# Altium schematic sheet FE.SchDoc
size 297 x 209 mm
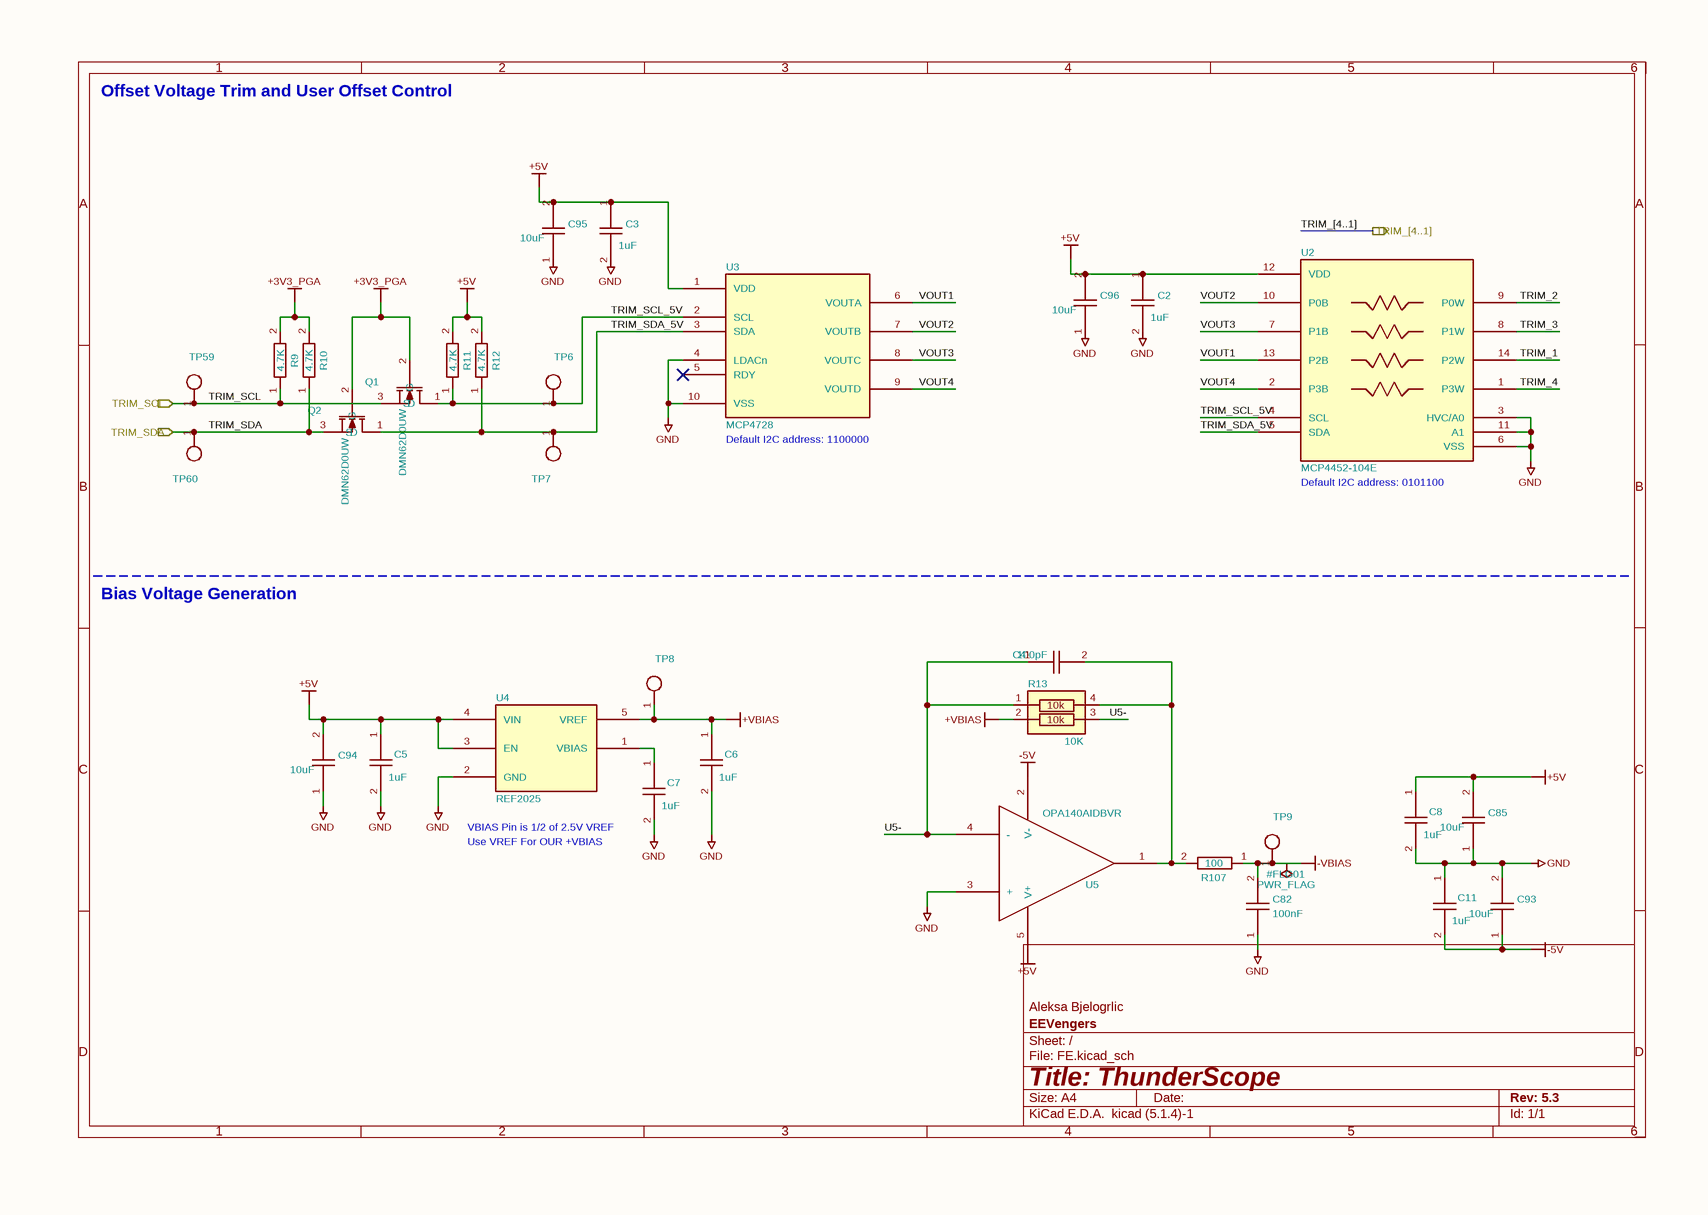
[diagram p0: FE.SchDoc]

## Parts
#FLG01  PWR_FLAG  (graphical)
C2  1uF  [GEN_C_0402]
C3  1uF  [GEN_C_0402]
C4  100pF  [GEN_C_0402]
C5  1uF  [GEN_C_0402]
C6  1uF  [GEN_C_0402]
C7  1uF  [GEN_C_0402]
C8  1uF  [GEN_C_0402]
C11  1uF  [GEN_C_0402]
C82  100nF  [GEN_C_0402]
C85  10uF  [GEN_C_0603]
C93  10uF  [GEN_C_0603]
C94  10uF  [GEN_C_0603]
C95  10uF  [GEN_C_0603]
C96  10uF  [GEN_C_0603]
Q1  DMN62D0UW  [GEN_SOT_323]
Q2  DMN62D0UW  [GEN_SOT_323]
R9  4.7K  [GEN_R_0402]
R10  4.7K  [GEN_R_0402]
R11  4.7K  [GEN_R_0402]
R12  4.7K  [GEN_R_0402]
R13  10K  [GEN_R_2ARRAY_0606]
R107  100  [GEN_R_0402]
TP6  PCB  [GEN_TP_PCB]  (value not drawn)
TP7  PCB  [GEN_TP_PCB]  (value not drawn)
TP8  PCB  [GEN_TP_PCB]  (value not drawn)
TP9  PCB  [GEN_TP_PCB]  (value not drawn)
TP59  PCB  [GEN_TP_PCB]  (value not drawn)
TP60  PCB  [GEN_TP_PCB]  (value not drawn)
U2  MCP4452-104E  [MC_TSSOP14]
U3  MCP4728  [MC_MSOP10_UN]
U4  REF2025  [GEN_SOT23_5_950_2900X1600X1450]
U5  OPA140AIDBVR  [GEN_SOT23_5_950_2900X1600X1450]

## Ports
TRIM_[4..1] (out), TRIM_SCL (in), TRIM_SDA (in)

## Nets
+3V3_PGA: Q1.2(G) Q2.2(G) R9.2 R10.2
+5V: C2.1 C3.1 C5.1 C8.1 C85.2 C94.2 C95.2 C96.2 R11.2 R12.2 U2.12(VDD) U3.1(VDD) U4.3(EN) U4.4(VIN) U5.5(V+)
+VBIAS: C6.1 R13.2 TP8.1 U4.5(VREF)
-5V: C11.2 C93.1 U5.2(V-)
-VBIAS: #FLG01.1 C82.2 R107.1 TP9.1
GND: C2.2 C3.2 C5.2 C6.2 C7.2 C8.2 C11.1 C82.1 C85.1 C93.2 C94.1 C95.1 C96.1 U2.3(HVC/A0) U2.6(VSS) U2.11(A1) U3.4(LDACn) U3.10(VSS) U4.2(GND) U5.3(+)
TRIM_1: U2.14(P2W)
TRIM_2: U2.9(P0W)
TRIM_3: U2.8(P1W)
TRIM_4: U2.1(P3W)
TRIM_SCL: Q1.3(S) R9.1 TP59.1 ; port TRIM_SCL
TRIM_SCL_5V: Q1.1(D) R11.1 TP6.1 U2.4(SCL) U3.2(SCL)
TRIM_SDA: Q2.3(S) R10.1 TP60.1 ; port TRIM_SDA
TRIM_SDA_5V: Q2.1(D) R12.1 TP7.1 U2.5(SDA) U3.3(SDA)
U5-: C4.1 R13.1 R13.3 U5.4(-)
VOUT1: U2.13(P2B) U3.6(VOUTA)
VOUT2: U2.10(P0B) U3.7(VOUTB)
VOUT3: U2.7(P1B) U3.8(VOUTC)
VOUT4: U2.2(P3B) U3.9(VOUTD)
NetC4_2: C4.2 R13.4 R107.2 U5.1(OUT)
NetC7_1: C7.1 U4.1(VBIAS)

Not connected (* = marked no-connect by the designer): U3 5(RDY)*

## Buses and harness runs
bus TRIM_[4..1] = port TRIM_[4..1]

## Notes on the sheet
- Offset Voltage Trim and User Offset Control
- (near U3) Default I2C address: 1100000
- (near U2) Default I2C address: 0101100
- Bias Voltage Generation
- Use VREF For OUR +VBIAS
- VBIAS Pin is 1/2 of 2.5V VREF
- 1
- 2
- 3
- 4
- 5
- 6
- A
- B
- C
- Aleksa Bjelogrlic
- D
- Title: ThunderScope
- File: FE.kicad_sch
- Sheet: /
- EEVengers
- KiCad E.D.A.  kicad (5.1.4)-1
- Size: A4
- Date:
- Rev: 5.3
- Id: 1/1
- (in symbol RES ARRAY 2x 10K OHM 0.05% 0606) 10k

## Library data of the parts
C2 C3 C5-C8 C11 = CAP 1uF 25V X5R 0402: MANUFACTURER: Murata; MANUFACTURER PART NUMBER: GRM155R61E105KA12D; VOLTAGE RATING: 25V; Substitutions Policy: Any Parametric Equivalent; PACKAGE: 0402; SUPPLIER 1: Mouser; SUPPLIER PART NUMBER 1: 81-GRM155R61E105KA2D; Footprint: Thunderscope_Rev5:GEN_C_0402; Value: 1uF
C4 = CAP 100pF 50V C0G 0402: MANUFACTURER: Murata; MANUFACTURER PART NUMBER: GCM1555C1H101FA16D; TEMPERATURE COEFFICIENT: C0G; VOLTAGE RATING: 50V; Substitutions Policy: Any Parametric Equivalent; PACKAGE: 0402; SUPPLIER 1: Mouser; SUPPLIER PART NUMBER 1: 81-GCM1555C1H101FA6D; Footprint: Thunderscope_Rev5:GEN_C_0402; Value: 100pF
C82 = CAP 100nF 16V X7R 0402: HOUSE PART NUMBER: C-100nF-0402-002; MANUFACTURER: Murata; MANUFACTURER PART NUMBER: GCM155R71C104KA55D; VOLTAGE RATING: 16V; Substitutions Policy: Any Parametric Equivalent; PACKAGE: 0402; SUPPLIER 1: Mouser; SUPPLIER PART NUMBER 1: 81-GCM155R71C104KA5D; Footprint: Thunderscope_Rev5:GEN_C_0402; Value: 100nF
C85 C93-C96 = CAP 10uF 25V X5R 0603: MANUFACTURER: Murata; MANUFACTURER PART NUMBER: GRM188R61E106MA73D; VOLTAGE RATING: 25V; Substitutions Policy: Any Parametric Equivalent; PACKAGE: 0402; SUPPLIER 1: Mouser; SUPPLIER PART NUMBER 1: 81-GRM188R61E106MA3D; Footprint: Thunderscope_Rev5:GEN_C_0603; Value: 10uF
Q1 Q2 = NMOS DMN62D0UW: HOUSE PART NUMBER: DMN62D0UW-7; MANUFACTURER: Diodes; VDSS: 60V; Substitutions Policy: ECO Required for Substitution; SUPPLIER 1: Mouser; SUPPLIER PART NUMBER 1: 621-DMN62D0UW-7; MANUFACTURER PART NUMBER: DMN62D0UW-7; PACKAGE: SOT-323; Value: DMN62D0UW; Footprint: Thunderscope_Rev5:GEN_SOT_323
R9-R12 = RES 4.7K OHM 1% 1/16W 0402: MANUFACTURER: Yageo; MANUFACTURER PART NUMBER: RC0402FR-074K7L; TOLERANCE: 1%; Substitutions Policy: Any Parametric Equivalent; PACKAGE: 0402; SUPPLIER 1: Mouser; SUPPLIER PART NUMBER 1: 603-RC0402FR-074K7L; Footprint: Thunderscope_Rev5:GEN_R_0402; Value: 4.7K
R13 = RES ARRAY 2x 10K OHM 0.05% 0606: MANUFACTURER: Vishay Beyschlag; MANUFACTURER PART NUMBER: ACASN1002S1002P1ATF1002X; TOLERANCE: 1%; Substitutions Policy: No Substitutions; PACKAGE: 0606; SUPPLIER 1: Mouser; SUPPLIER PART NUMBER 1: 594-ACASN1002S1002AT; Footprint: Thunderscope_Rev5:GEN_R_2ARRAY_0606; Value: 10K
R107 = RES 100 OHM 1% 1/10W 0402: MANUFACTURER: Yageo; MANUFACTURER PART NUMBER: RC0402FR-07100RL; TOLERANCE: 1%; Substitutions Policy: Any Parametric Equivalent; PACKAGE: 0402; SUPPLIER 1: Mouser; SUPPLIER PART NUMBER 1: 603-RC0402FR-07100RL; Footprint: Thunderscope_Rev5:GEN_R_0402; Value: 100
TP6-TP9 TP59 TP60 = TP PCB 1mm: Footprint: Thunderscope_Rev5:GEN_TP_PCB; Value: PCB
U2 = IC DIGIPOT QUAD MCP4452-104E: MANUFACTURER: Microchip; Substitutions Policy: ECO Required for Substitution; SUPPLIER 1: Mouser; SUPPLIER PART NUMBER 1: 579-MCP4452-104E/ST; MANUFACTURER PART NUMBER: MCP4452-104E; PACKAGE: 14-TSSOP; Value: MCP4452-104E; Footprint: Thunderscope_Rev5:MC_TSSOP14
U3 = IC DAC QUAD MCP4728: MANUFACTURER: Microchip; MANUFACTURER PART NUMBER: MCP4728T-E/UN; Substitutions Policy: ECO Required for Substitution; SUPPLIER 1: Mouser; SUPPLIER PART NUMBER 1: 579-MCP4728T-E/UN; PACKAGE: 10-MSOP; Value: MCP4728; Footprint: Thunderscope_Rev5:MC_MSOP10_UN
U4 = IC VREF REF2025: MANUFACTURER: Texas Instruments; MANUFACTURER PART NUMBER: REF2025AIDDCR; Substitutions Policy: No Substitutions; SUPPLIER 1: Texas Instruments; SUPPLIER PART NUMBER 1: REF2025AIDDCR; PACKAGE: SOT-23-5; Value: REF2025; Footprint: Thunderscope_Rev5:GEN_SOT23_5_950_2900X1600X1450
U5 = IC OPAMP OPA140: MANUFACTURER: Texas Instruments; Substitutions Policy: No Substitutions; SUPPLIER 1: Texas Instruments; SUPPLIER PART NUMBER 1: OPA140AIDBVR; MANUFACTURER PART NUMBER: OPA140AIDBVR; PACKAGE: SOT-23-5; Value: OPA140AIDBVR; Footprint: Thunderscope_Rev5:GEN_SOT23_5_950_2900X1600X1450
#FLG01 = PWR_FLAG: Value: PWR_FLAG